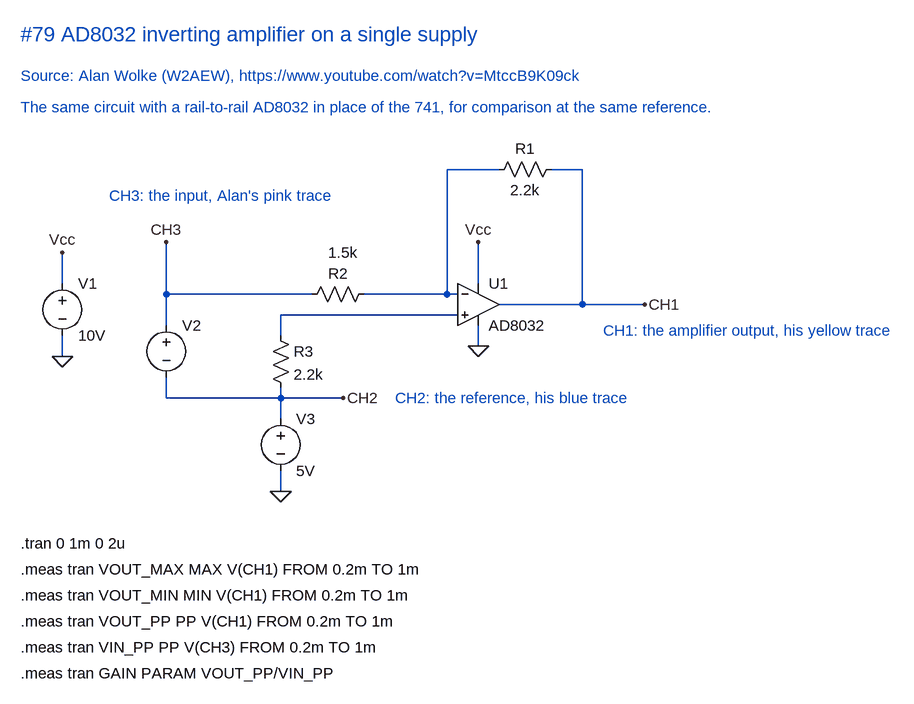
[diagram p0: schematic AD8032 Op Amp.asc]
AD8032 Op Amp.asc, the LTspice schematic file:
Version 4.1
SHEET 1 1504 960
WIRE 800 -16 720 -16
WIRE 928 -16 880 -16
WIRE 128 160 128 112
WIRE 768 160 768 96
WIRE 288 176 288 96
WIRE 512 176 288 176
WIRE 720 176 720 -16
WIRE 720 176 592 176
WIRE 736 176 720 176
WIRE 928 192 928 -16
WIRE 928 192 800 192
WIRE 1024 192 928 192
WIRE 736 208 464 208
WIRE 288 224 288 176
WIRE 464 240 464 208
WIRE 768 256 768 224
WIRE 128 272 128 240
WIRE 288 336 288 304
WIRE 464 336 464 320
WIRE 464 336 288 336
WIRE 560 336 464 336
WIRE 464 368 464 336
WIRE 464 480 464 448
FLAG 128 112 Vcc
FLAG 128 272 0
FLAG 288 96 CH3
FLAG 560 336 CH2
FLAG 464 480 0
FLAG 768 96 Vcc
FLAG 768 256 0
FLAG 1024 192 CH1
SYMBOL voltage 128 144 R0
SYMATTR InstName V1
SYMATTR Value 10V
SYMBOL voltage 288 208 R0
WINDOW 3 0 0 Invisible 2
SYMATTR Value SINE(0 2V 5kHz)
SYMATTR InstName V2
SYMBOL voltage 464 352 R0
SYMATTR InstName V3
SYMATTR Value 5V
SYMBOL res 784 0 R270
WINDOW 0 32 56 VTop 2
WINDOW 3 0 56 VBottom 2
SYMATTR InstName R1
SYMATTR Value 2.2k
SYMBOL res 496 192 R270
WINDOW 0 32 56 VTop 2
WINDOW 3 64 64 VTop 2
SYMATTR InstName R2
SYMATTR Value 1.5k
SYMBOL res 448 224 R0
SYMATTR InstName R3
SYMATTR Value 2.2k
SYMBOL OpAmps\\AD8032 768 128 R0
SYMATTR InstName U1
TEXT 64 -224 Left 3 ;#79 AD8032 inverting amplifier on a single supply
TEXT 64 -160 Left 2 ;Source: Alan Wolke (W2AEW), https://www.youtube.com/watch?v=MtccB9K09ck
TEXT 64 -112 Left 2 ;The same circuit with a rail-to-rail AD8032 in place of the 741, for comparison at the same reference.
TEXT 200 24 Left 2 ;CH3: the input, Alan's pink trace
TEXT 640 336 Left 2 ;CH2: the reference, his blue trace
TEXT 960 232 Left 2 ;CH1: the amplifier output, his yellow trace
TEXT 64 560 Left 2 !.tran 0 1m 0 2u
TEXT 64 600 Left 2 !.meas tran VOUT_MAX MAX V(CH1) FROM 0.2m TO 1m
TEXT 64 640 Left 2 !.meas tran VOUT_MIN MIN V(CH1) FROM 0.2m TO 1m
TEXT 64 680 Left 2 !.meas tran VOUT_PP PP V(CH1) FROM 0.2m TO 1m
TEXT 64 720 Left 2 !.meas tran VIN_PP PP V(CH3) FROM 0.2m TO 1m
TEXT 64 760 Left 2 !.meas tran GAIN PARAM VOUT_PP/VIN_PP

The netlist it stands for:
* AD8032 Op Amp.asc
V1 Vcc 0 10V
V2 CH3 CH2 SINE(0 2V 5kHz)
V3 CH2 0 5V
R1 N001 CH1 2.2k
R2 CH3 N001 1.5k
R3 N002 CH2 2.2k
X§U1 N002 N001 Vcc 0 CH1 AD8032  ; pins In+ In- V+ V- OUT
* #79 AD8032 inverting amplifier on a single supply
* Source: Alan Wolke (W2AEW), https://www.youtube.com/watch?v=MtccB9K09ck
* The same circuit with a rail-to-rail AD8032 in place of the 741, for comparison at the same reference.
* CH3: the input, Alan's pink trace
* CH2: the reference, his blue trace
* CH1: the amplifier output, his yellow trace
.tran 0 1m 0 2u
.meas tran VOUT_MAX MAX V(CH1) FROM 0.2m TO 1m
.meas tran VOUT_MIN MIN V(CH1) FROM 0.2m TO 1m
.meas tran VOUT_PP PP V(CH1) FROM 0.2m TO 1m
.meas tran VIN_PP PP V(CH3) FROM 0.2m TO 1m
.meas tran GAIN PARAM VOUT_PP/VIN_PP
.backanno
.end